# Altium schematic sheet PiggySat-antenna.SchDoc: PiggySat-antenna
size A4; DocumentNumber: 001; Revision: 1.0; SheetNumber: 1; SheetTotal: 1
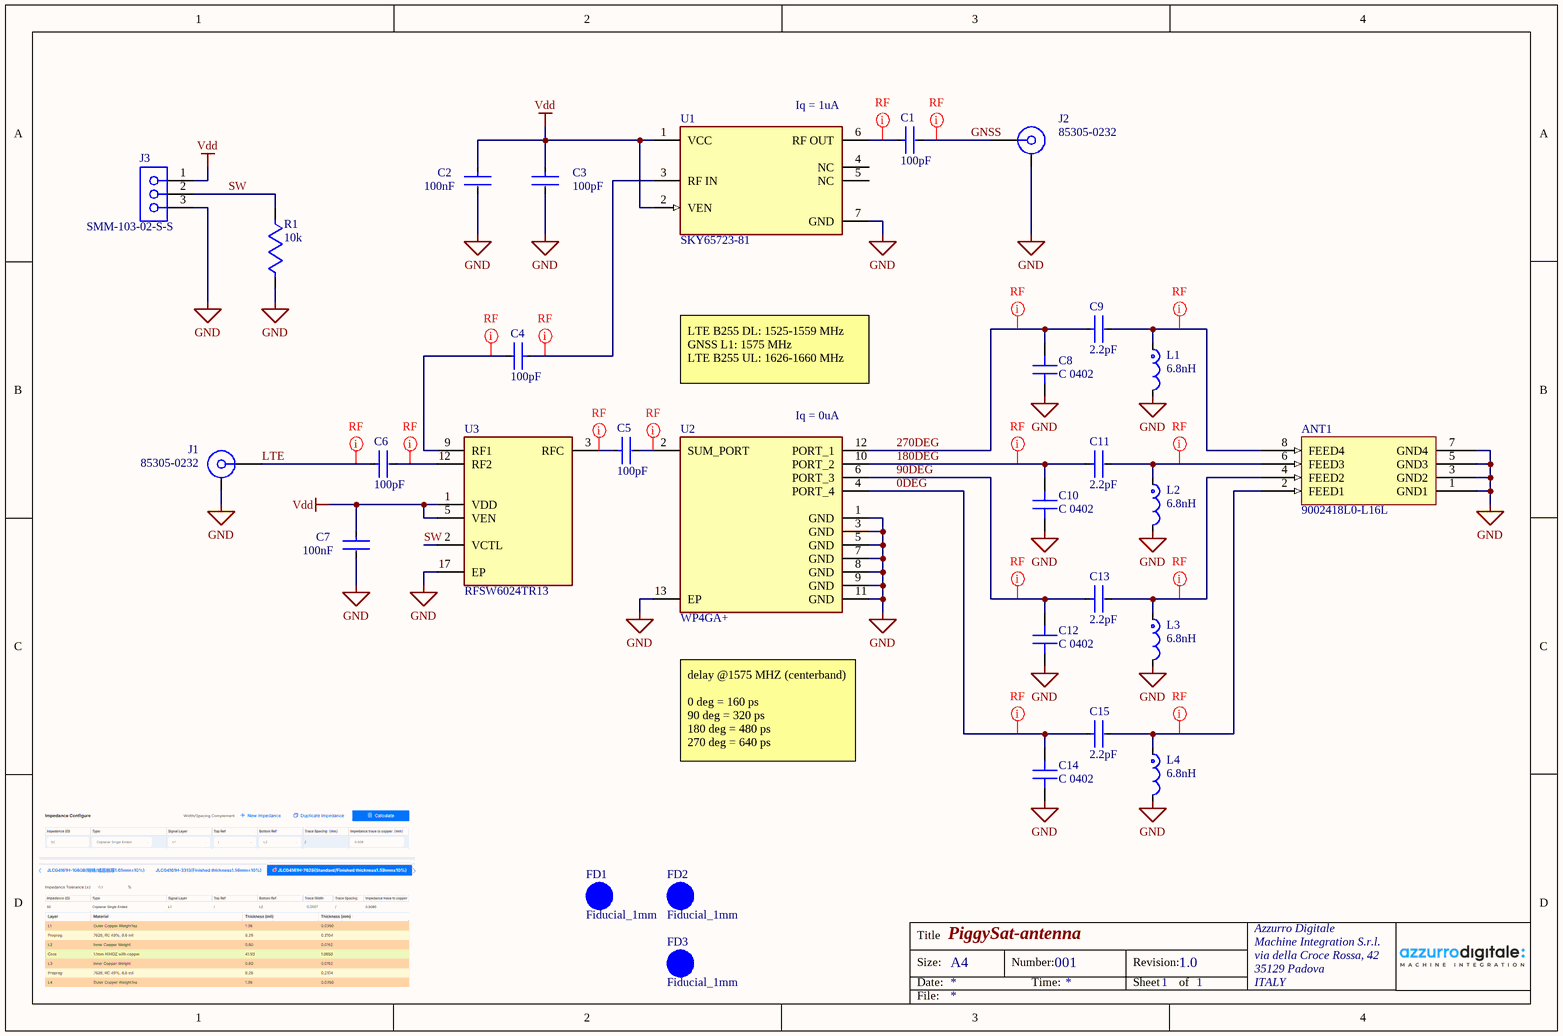
[diagram p0: PiggySat-antenna.SchDoc]

## Parts
ANT1  9002418L0-L16L  [9002418L0-L16L-Footprint-1]
C1  Capacitance: 100pF  [FP-GCM155-0_05-IPC_C]  (hidden comment: GCM1555C1H101JA16D)
C2  Capacitance: 100nF  [FP-GRM155-0_05-MFG]  (hidden comment: GRM155R71C104KA88J)
C3  Capacitance: 100pF  [FP-GCM155-0_05-IPC_C]  (hidden comment: GCM1555C1H101JA16D)
C4  Capacitance: 100pF  [FP-GCM155-0_05-IPC_C]  (hidden comment: GCM1555C1H101JA16D)
C5  Capacitance: 100pF  [FP-GCM155-0_05-IPC_C]  (hidden comment: GCM1555C1H101JA16D)
C6  Capacitance: 100pF  [FP-GCM155-0_05-IPC_C]  (hidden comment: GCM1555C1H101JA16D)
C7  Capacitance: 100nF  [FP-GRM155-0_05-MFG]  (hidden comment: GRM155R71C104KA88J)
C8  C 0402  [cap_0402]  (no BOM)
C9  Capacitance: 2.2pF  [FP-GJM155-0_05-IPC_C]  (hidden comment: GJM1555C1H2R2BB01D)
C10  C 0402  [cap_0402]  (no BOM)
C11  Capacitance: 2.2pF  [FP-GJM155-0_05-IPC_C]  (hidden comment: GJM1555C1H2R2BB01D)
C12  C 0402  [cap_0402]  (no BOM)
C13  Capacitance: 2.2pF  [FP-GJM155-0_05-IPC_C]  (hidden comment: GJM1555C1H2R2BB01D)
C14  C 0402  [cap_0402]  (no BOM)
C15  Capacitance: 2.2pF  [FP-GJM155-0_05-IPC_C]  (hidden comment: GJM1555C1H2R2BB01D)
FD1  Fiducial_1mm  [Fiducial_1mm-Footprint-1]  (no BOM)
FD2  Fiducial_1mm  [Fiducial_1mm-Footprint-1]  (no BOM)
FD3  Fiducial_1mm  [Fiducial_1mm-Footprint-1]  (no BOM)
J1  85305-0232  [MOLEX_85305-0232]
J2  85305-0232  [MOLEX_85305-0232]
J3  SMM-103-02-S-S  [SMM-103-02-SM-S]
L1  Inductance: 6.8nH  [FP-LQG15HH_02-MFG]  (hidden comment: LQG15HZ6N8J02D)
L2  Inductance: 6.8nH  [FP-LQG15HH_02-MFG]  (hidden comment: LQG15HZ6N8J02D)
L3  Inductance: 6.8nH  [FP-LQG15HH_02-MFG]  (hidden comment: LQG15HZ6N8J02D)
L4  Inductance: 6.8nH  [FP-LQG15HH_02-MFG]  (hidden comment: LQG15HZ6N8J02D)
R1  10k  [RESC1005X04L]
U1  SKY65723-81  [FP-SKY65723-81-MFG]
U2  WP4GA+  [WP4_12QFN]
U3  RFSW6024TR13  [QFN65P400X400X90-17N]

## Nets
GND: ANT1.1(GND1) ANT1.3(GND2) ANT1.5(GND3) ANT1.7(GND4) C2.2 C3.2 C7.2 C8.1 C10.1 C12.1 C14.1 J1.2 J2.2 J3.3 L1.2 L2.2 L3.2 L4.2 R1.1 U1.7(GND) U2.1(GND) U2.3(GND) U2.5(GND) U2.7(GND) U2.8(GND) U2.9(GND) U2.11(GND) U2.13(EP) U3.17(EP)
Vdd: C2.1 C3.1 C7.1 J3.1 U1.1(VCC) U1.2(VEN) U3.1(VDD) U3.5(VEN)
0DEG: C14.2 C15.1 U2.4(PORT_4)
90DEG: C12.2 C13.1 U2.6(PORT_3)
180DEG: C10.2 C11.1 U2.10(PORT_2)
270DEG: C8.2 C9.1 U2.12(PORT_1)
GNSS: C1.2 J2.1
LTE: C6.1 J1.1
SW: J3.2 R1.2 U3.2(VCTL)
NetANT1_2: ANT1.2(FEED1) C15.2 L4.1
NetANT1_4: ANT1.4(FEED2) C13.2 L3.1
NetANT1_6: ANT1.6(FEED3) C11.2 L2.1
NetANT1_8: ANT1.8(FEED4) C9.2 L1.1
NetC1_1: C1.1 U1.6(RF_OUT)
NetC4_1: C4.1 U1.3(RF_IN)
NetC4_2: C4.2 U3.9(RF1)
NetC5_1: C5.1 U3.3(RFC)
NetC5_2: C5.2 U2.2(SUM_PORT)
NetC6_2: C6.2 U3.12(RF2)

Not connected (* = marked no-connect by the designer): U1 4(NC) 5(NC)

## Layout directives
net class RF: 0DEG, 90DEG, 180DEG, 270DEG, GNSS, LTE, NetANT1_2, NetANT1_4, NetANT1_6, NetANT1_8, NetC1_1, NetC4_1, NetC4_2, NetC5_1, NetC5_2, NetC6_2

## Notes on the sheet
- (near U1) Iq = 1uA
- LTE B255 DL: 1525-1559 MHz
  GNSS L1: 1575 MHz
  LTE B255 UL: 1626-1660 MHz
- (near U2) Iq = 0uA
- delay @1575 MHZ (centerband)
  0 deg = 160 ps
  90 deg = 320 ps
  180 deg = 480 ps
  270 deg = 640 ps
- Title
- Size:
- Date:
- A4
- Number:
- Time:
- Revision:
- Sheet
- of
- Azzurro Digitale
- Machine Integration S.r.l.
- via della Croce Rossa, 42
- 35129 Padova
- ITALY
- File:

## Library data of the parts
ANT1 = 9002418L0-L16L: Internal Antenna, L-Band, Cap/1.7/1.6Dbi Rohs Compliant: Yes |Kyocera Avx 9002418L0-L16L; Introduction Date: 2025-04-03; Lifecycle Status: Production; RoHS: Compliant; REACH SVHC: Yes
C1 C3-C6 = CMP-2008-03694-3: Ceramic Capacitor for Automotive 100pF ±5% 50VDC C0G 0402 Paper T/R; Voltage: 50V; Ratings: AEC-Q200; Radiation Hardening: No; Min Operating Temperature: -55°C; Depth: 0.5mm; Max Operating Temperature: 125°C; Length: 1mm; Height: 0.5mm; Termination: SMD/SMT; Voltage Rating: 50V; Dielectric: C0G; Package Quantity: 10000; Case Code (Imperial): 0402; Width: 0.02inch; Case/Package: 0402; Lead Free: Lead Free; Case Code (Metric): 1005; Voltage Rating (DC): 50V; Thickness: 0.022inch; Mount: Surface Mount; Tolerance: 5%; REACH SVHC: No SVHC; Weight: 0.000212oz; Packaging: Tape and Reel
C2 C7 = CMP-2008-03928-2: Multilayer Ceramic Capacitors MLCC - SMD/SMT 0.1 uF 16 VDC 10% 0402 X7R; NexarPartId: 9223238; Manufacturer Lifecycle Status: NRND; Voltage: 16V; Schedule B: 8532240020, 8532240020; Mount: Surface Mount; Case/Package: 0402; Case Code (Imperial): 0402; Min Operating Temperature: -55°C; Length: 1mm; Voltage Rating (DC): 16V; Depth: 500µm; Lead Free: Lead Free; Max Operating Temperature: 125°C; Case Code (Metric): 1005; Tolerance: 10%; Radiation Hardening: No; Height: 550µm; Voltage Rating: 16V; Packaging: Cut Tape; RoHS: Compliant; Width: 500µm; Number of Pins: 2; Dielectric: X7R; REACH SVHC: No SVHC; Material: Ceramic; Termination: SMD/SMT; Thickness: 500µm
C8 C10 C12 C14 = CAP_0402
C9 C11 C13 C15 = CMP-2008-03835-2: Multi-Layer Ceramic Capacitor 2.2pF C0G  ±0.1pF 0402 Paper T/R; Voltage Rating: 50V; Temperature Coefficient: 30ppm/°C; Width: 0.5mm; Dielectric: C0G; Mount: Surface Mount; Thickness: 0.022inch; Lead Pitch: 0.3mm; Depth: 0.5mm; Case Code (Metric): 1005; Lead Free: Lead Free; Min Operating Temperature: -55°C; Number of Pins: 2; Radiation Hardening: No; Case/Package: 0402; Voltage: 50V; Max Operating Temperature: 125°C; Height: 0.5mm; Package Quantity: 10000; REACH SVHC: No SVHC; Packaging: Tape and Reel; Case Code (Imperial): 0402; Termination: SMD/SMT; Voltage Rating (DC): 50V; Length: 1mm
FD1-FD3 = CMP-00017-7: 1mm fiducial marker
J1 J2 = 85305-0232: Circular Connector, SMP STRAIGHT PLUG, PCB, 85305 SMP RF Connectors Series; Manufacturer: MOLEX; ComponentLink5Description: Webshop / RFQ; ComponentLink5URL: http://www.rosenberger.com/en/contact/sales/; ComponentLink3URL: http://rosenberger.de/ok/images/documents/db/32K145-400L5.pdf; ComponentLink2URL: http://rosenberger.de/ok/images/documents/db/32K145-400L5.pdf; ComponentLink4Description: Series Overview / Design Note; ComponentLink1Description: Manufacturer URL; ComponentLink2Description: Datasheet; ComponentLink3Description: Package Specification; ComponentLink1URL: http://www.rosenberger.de; ComponentLink4URL: http://rosenberger.de/ok/images/documents/spez/32.pdf; Mounting Technology: Surface Mount; System: Connector
J3 = SMM-103-02-SM-S: SMM Series 2.00 mm Tiger Eye™ High-Reliability Socket Strip; System: Connector
L1-L4 = CMP-06042-011185-1: Multilayer type Inductor for Automotive 6.8nH ±5% 0.22Ω 600mA 0402; Test Frequency: 100MHz; Shielding: Unshielded; Self Resonant Frequency: 4.5GHz; DC Resistance (DCR): 220mR; Core Material: Air; Case/Package: 0402; Mount: Surface Mount; Packaging: Tape and Reel; Max Operating Temperature: 125°C; Current Rating: 600mA; Tolerance: 5%; Ratings: AEC-Q200; Min Operating Temperature: -55°C
R1 = CMP-009-00001-2: Res 10k 0402
U1 = CMP-85924-000002-1: IC RF AMP LNA GPS/GNSS SPFS; Series: *; RoHS Compliant: Yes
U2 = WP4GA+: 4 Ways MMIC Power Splitter, 1420 - 1660 MHz, 50Ω; MF: Mini-Circuits; MP: WP4G1+; SnapEDA_Link: https://www.snapeda.com/parts/WP4G1+/Mini-Circuits/view-part/?ref=snap; Package: VQFN-12 Mini-Circuits; Value: *; Check_prices: https://www.snapeda.com/parts/WP4G1+/Mini-Circuits/view-part/?ref=eda
U3 = RFSW6024TR13: 5 - 6000 MHz Absorptive High Isolation SPDT Switch; Manufacturer_Name: Qorvo; Geometry.Height: 0.9mm; Mouser Part Number: 772-RFSW6024TR13; Mouser Price/Stock: https://www.mouser.co.uk/ProductDetail/Qorvo/RFSW6024TR13?qs=u4fy%2FsgLU9NLk9lDlNNCYg%3D%3D; Manufacturer_Part_Number: RFSW6024TR13; Datasheet Link: https://www.qorvo.com/products/d/da001155